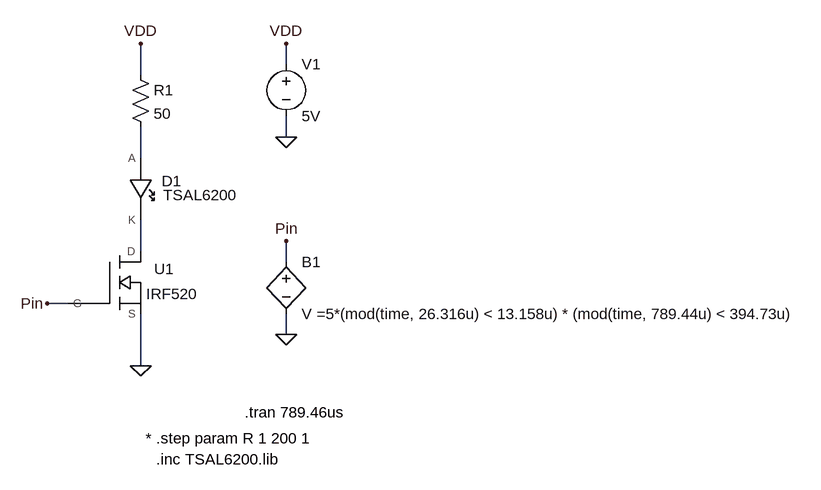
[diagram p0: schematic Transmitter.asc]
Transmitter.asc, the LTspice schematic file:
Version 4.1
SHEET 1 1316 704
WIRE 432 80 432 48
WIRE 208 96 208 48
WIRE 432 192 432 160
WIRE 208 224 208 176
WIRE 208 368 208 320
WIRE 432 384 432 352
WIRE 96 448 64 448
WIRE 432 496 432 464
WIRE 208 544 208 464
FLAG 208 544 0
FLAG 208 48 VDD
FLAG 64 448 Pin
FLAG 432 48 VDD
FLAG 432 192 0
FLAG 432 352 Pin
FLAG 432 496 0
SYMBOL res 192 80 R0
SYMATTR InstName R1
SYMATTR Value 50
SYMBOL voltage 432 64 R0
SYMATTR InstName V1
SYMATTR Value 5V
SYMBOL TSAL6200 224 288 R0
SYMATTR InstName D1
SYMBOL irf520 176 416 R0
SYMATTR InstName U1
SYMBOL bv 432 368 R0
SYMATTR InstName B1
SYMATTR Value V =5*(mod(time, 26.316u) < 13.158u) * (mod(time, 789.44u) < 394.73u)
TEXT 216 656 Left 2 !* .step param R 1 200 1
TEXT 232 688 Left 2 !.inc TSAL6200.lib
TEXT 368 616 Left 2 !.tran 789.46us

The netlist it stands for:
* Transmitter.asc
R1 VDD N001 50
V1 VDD 0 5V
D1 N001 N002 TSAL6200
X§U1 N002 Pin 0 IRF520  ; pins D G S
B1 Pin 0 V =5*(mod(time, 26.316u) < 13.158u) * (mod(time, 789.44u) < 394.73u)
.model D D
.lib standard.dio
* .step param R 1 200 1
.inc TSAL6200.lib
.tran 789.46us
.lib TSAL6200.lib
.lib irf520.lib
.backanno
.end